# EasyEDA Pro project EdgeFouce_云台及电源管理.eprj, schematic Schematic1, sheet 5 of 5

## Sheets
5 电源切换: Page Name: P1
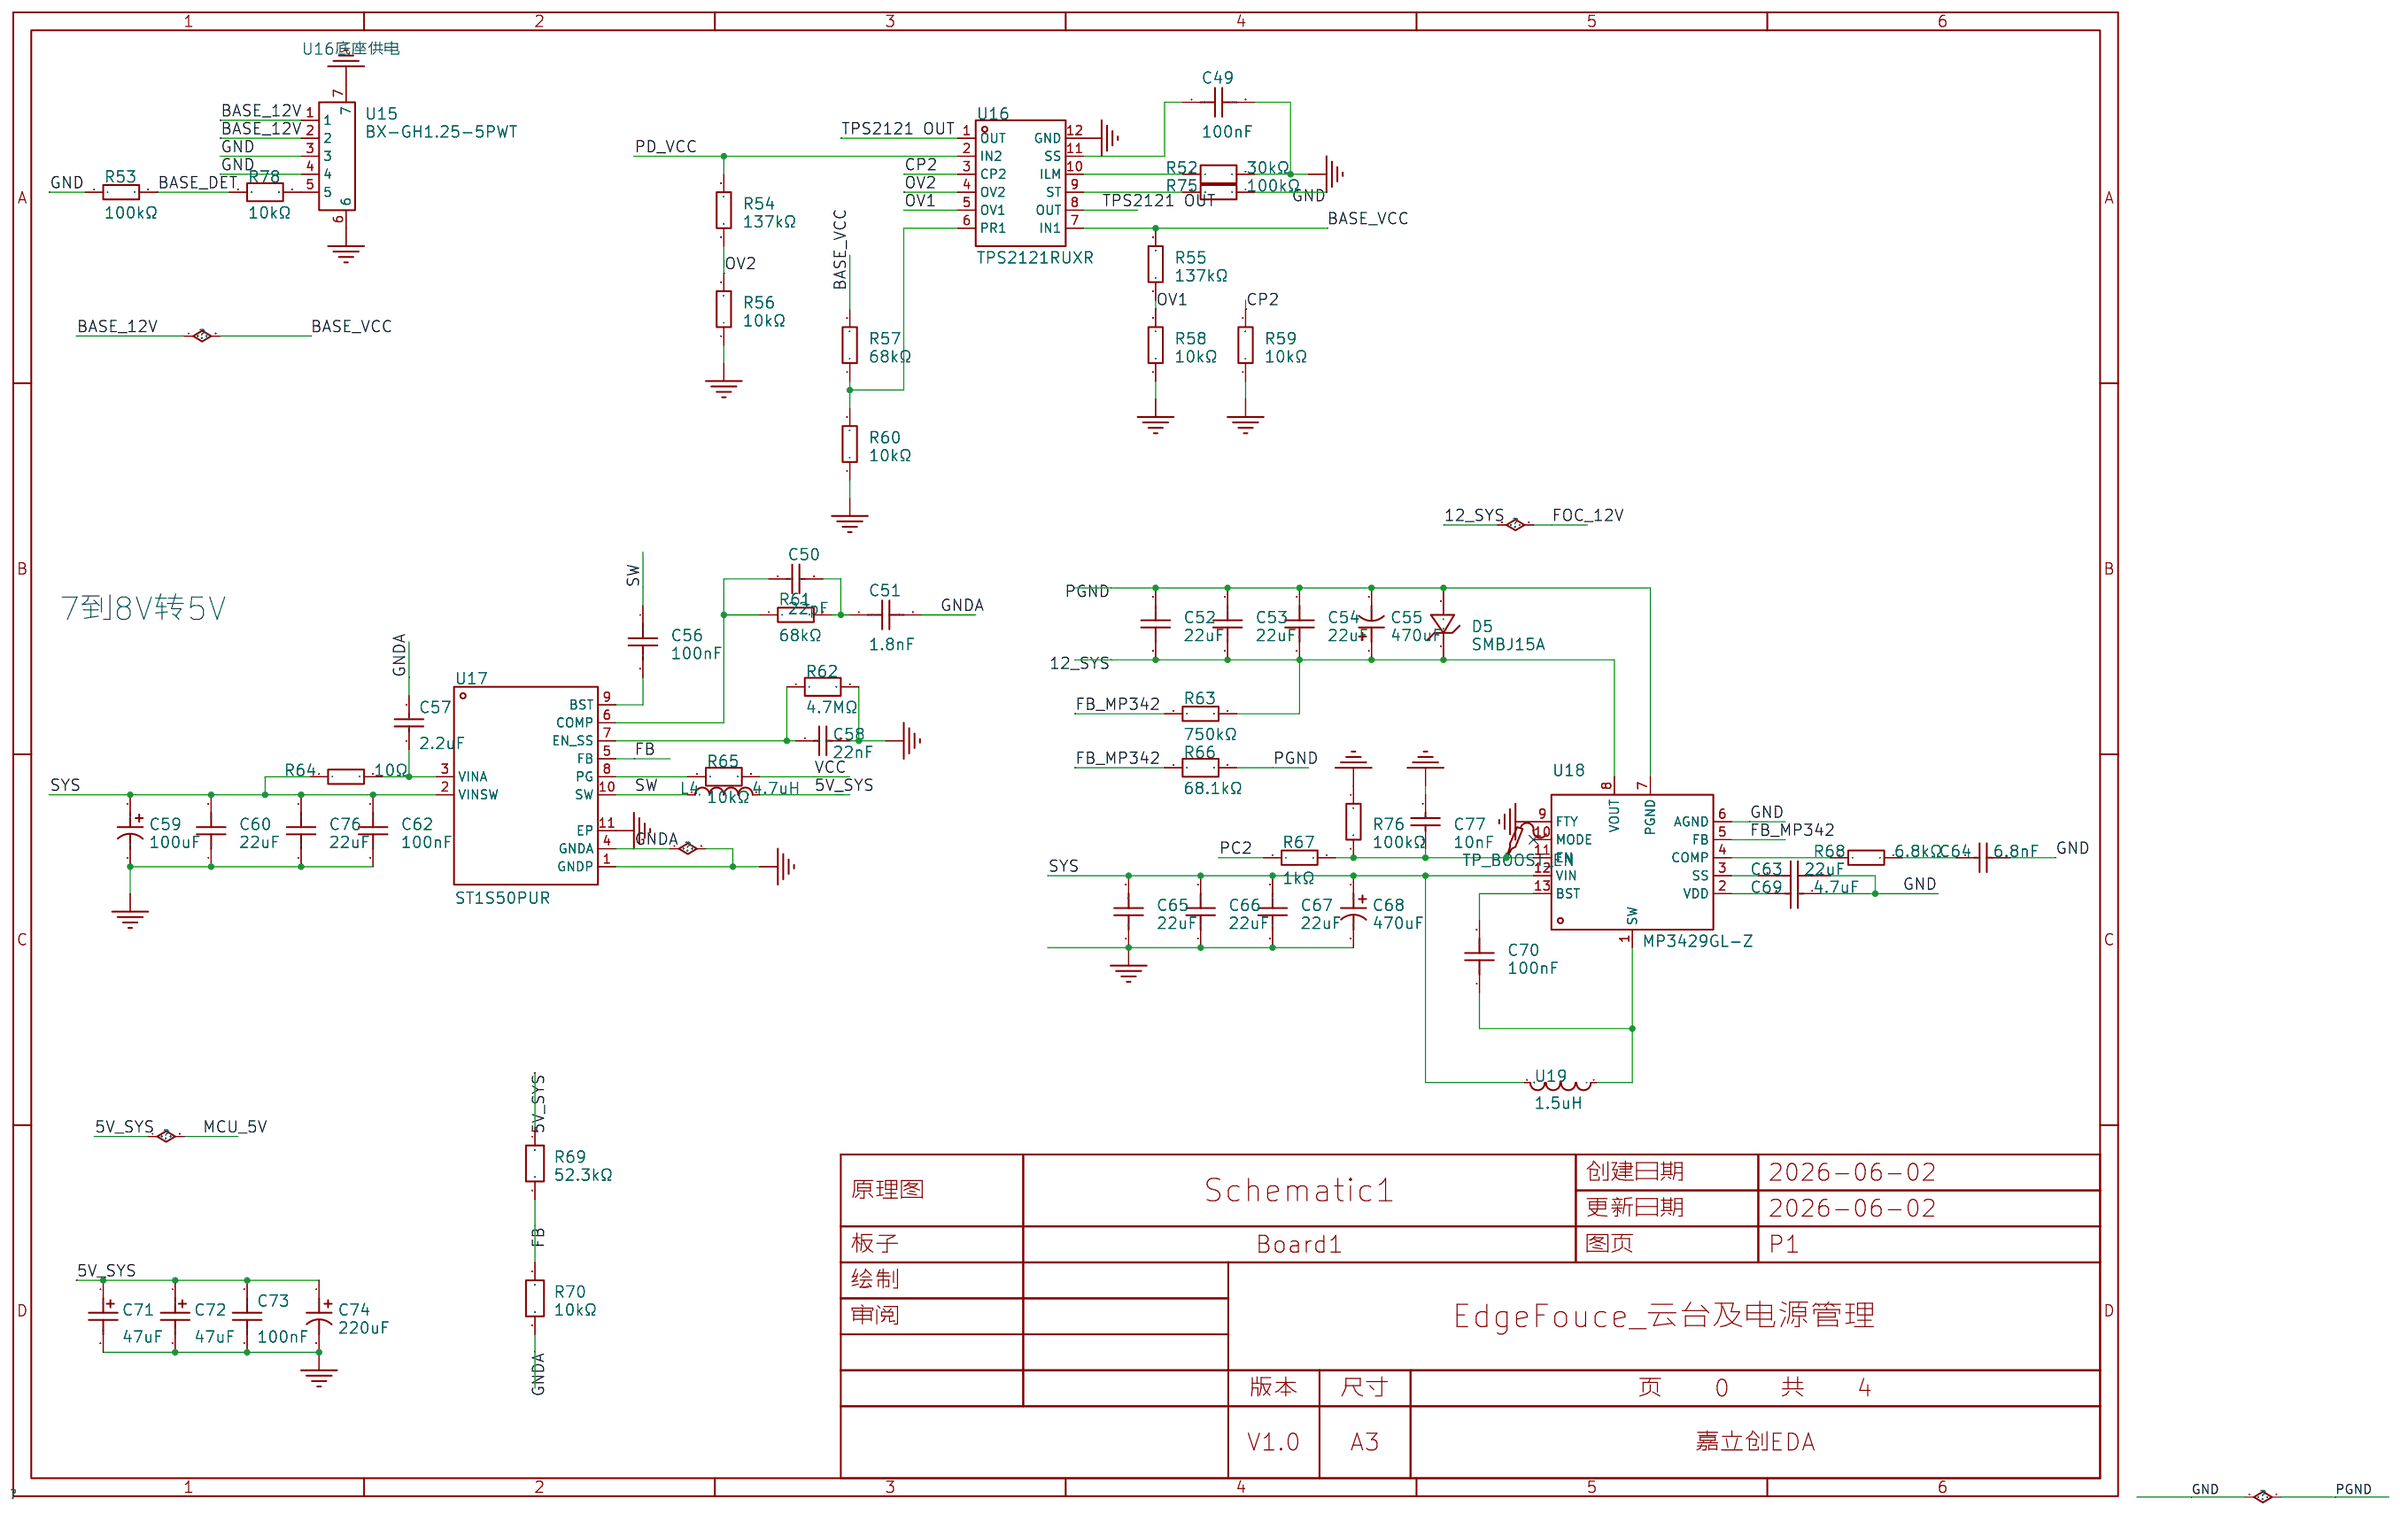
[diagram p4: 电源切换]

## Parts
C49  100nF  [C0805]
C50  22pF  [C0805]
C51  1.8nF  [C0603]
C52  22uF  [C0805]
C53  22uF  [C0805]
C54  22uF  [C0805]
C55  470uF  [CAP-SMD_BD10.0-L10.3-W10.3-LS11.0]
C56  100nF  [C0603]
C57  2.2uF  [C0603]
C58  22nF  [C0805]
C59  100uF  [CAP-SMD_BD6.3-L6.6-W6.6-RD]
C60  22uF  [C0805]
C62  100nF  [C0805]
C63  22uF  [C0805]
C64  6.8nF  [C0805]
C65  22uF  [C0805]
C66  22uF  [C0805]
C67  22uF  [C0805]
C68  470uF  [CAP-SMD_BD10.0-L10.3-W10.3-LS11.0]
C69  4.7uF  [C0805]
C70  100nF  [C0805]
C71  47uF  [CAP-SMD_L3.5-W2.8]
C72  47uF  [CAP-SMD_L3.5-W2.8]
C73  100nF  [C0603]
C74  220uF  [CAP-SMD_BD6.3-L6.6-W6.6-LS7.3-FD-H7.7]
C76  22uF  [C0805]
C77  10nF  [C0805]
D5  SMBJ15A  [SMB_L4.6-W3.6-LS5.3-RD]
L4  4.7uH  [IND-SMD_L7.5-W6.6]
R52  30kΩ  [R0805]
R53  100kΩ  [R0805]
R54  137kΩ  [R0805]
R55  137kΩ  [R0805]
R56  10kΩ  [R0805]
R57  68kΩ  [R0805]
R58  10kΩ  [R0805]
R59  10kΩ  [R0805]
R60  10kΩ  [R0805]
R61  68kΩ  [R0805]
R62  4.7MΩ  [R0805]
R63  750kΩ  [R0805]
R64  10Ω  [R0603]
R65  10kΩ  [R0805]
R66  68.1kΩ  [R0805]
R67  1kΩ  [R0805]
R68  6.8kΩ  [R0805]
R69  52.3kΩ  [R0603]
R70  10kΩ  [R0603]
R75  100kΩ  [R0805]
R76  100kΩ  [R0805]
R78  10kΩ  [R0805]
TP_BOOST_EN  -  [Test-Point-0.5mm]
U15  BX-GH1.25-5PWT  [CONN-SMD_5P-P1.25_BX-GH1.25-5PWT]
U16  TPS2121RUXR  [VQFN-HR-12_L2.5-W2.0-P0.50-BL]
U17  ST1S50PUR  [DFN-10_L3.0-W3.0-P0.50-BL-EP2.4-1]
U18  MP3429GL-Z  [QFN-13_L3.0-W4.0-P0.50-BL]
U19  1.5uH  [IND-SMD_L7.0-W6.6]

## Library data of the parts
C49 C62 = CC0805KRX7R9BB104: 容值:100nF;精度:±10%;额定电压:50V;温度系数:X7R;; LCSC Part Name: 100nF ±10% 50V; Supplier Part: C49678; Manufacturer: YAGEO(国巨); Supplier Footprint: 0805; JLCPCB Part Class: Basic Part; Datasheet: https://item.szlcsc.com/datasheet/CC0805KRX7R9BB104/50686.html; Supplier: LCSC; Tolerance: ±10%; Voltage Rating: 50V; Temperature Coefficient: X7R
C50 = CL21C220JBANNNC: 容值:22pF;精度:±5%;额定电压:50V;温度系数:C0G;; LCSC Part Name: 22pF ±5% 50V; Supplier Part: C1804; Manufacturer: SAMSUNG(三星); Supplier Footprint: 0805; JLCPCB Part Class: Basic Part; Datasheet: https://item.szlcsc.com/datasheet/CL21C220JBANNNC/2156.html; Supplier: LCSC; Tolerance: ±5%; Voltage Rating: 50V; Temperature Coefficient: C0G
C51 = CL10C182JB8NNNC: 容值:1.8nF;精度:±5%;额定电压:50V;温度系数:C0G;; LCSC Part Name: 1.8nF ±5% 50V; Supplier Part: C318642; Manufacturer: SAMSUNG(三星); Supplier Footprint: 0603; JLCPCB Part Class: Extended Part; Datasheet: https://item.szlcsc.com/datasheet/CL10C182JB8NNNC/299771.html; Supplier: LCSC; Tolerance: ±5%; Voltage Rating: 50V; Temperature Coefficient: C0G
C52-C54 C60 C63 C65-C67 C76 = CGA0805X5R226M250MT: 容值:22uF;精度:±20%;额定电压:25V;温度系数:X5R;; LCSC Part Name: 22uF ±20% 25V; Supplier Part: C6119899; Manufacturer: HRE(芯声); Supplier Footprint: 0805; JLCPCB Part Class: Extended Part; Datasheet: https://item.szlcsc.com/datasheet/CGA0805X5R226M250MT/7062605.html; Supplier: LCSC; Tolerance: ±20%; Voltage Rating: 25V; Temperature Coefficient: X5R
C55 C68 = JVJ35V470M10x10: 容值:470uF;精度:±20%;额定电压:35V;纹波电流:320mA@120Hz;; LCSC Part Name: 470uF ±20% 35V; Supplier Part: C46550413; Manufacturer: JIERR(捷而瑞); Supplier Footprint: SMD,D10xL10.5mm; JLCPCB Part Class: Extended Part; Datasheet: https://item.szlcsc.com/datasheet/JVJ35V470M10x10/48680107.html; Supplier: LCSC; Tolerance: ±20%; Voltage Rating: 35V; Ripple Current: 320mA@120Hz; Diameter: 10mm; Height - Seated (Max): 10.5mm; Lifetime: 2000hrs@105℃; Operating Temperature: -55℃~+105℃
C56 C73 = CGA0603X7R104K500JT: 容值:100nF;精度:±10%;额定电压:50V;温度系数:X7R;; LCSC Part Name: 100nF ±10% 50V; Supplier Part: C6119867; Manufacturer: HRE(芯声); Supplier Footprint: 0603; JLCPCB Part Class: Extended Part; Datasheet: https://item.szlcsc.com/datasheet/CGA0603X7R104K500JT/7062573.html; Supplier: LCSC; Tolerance: ±10%; Voltage Rating: 50V; Temperature Coefficient: X7R
C57 = CL10A225KO8NNNC: 容值:2.2uF;精度:±10%;额定电压:16V;温度系数:X5R;; LCSC Part Name: 2.2uF ±10% 16V; Supplier Part: C23630; Manufacturer: SAMSUNG(三星); Supplier Footprint: 0603; JLCPCB Part Class: Basic Part; Datasheet: https://item.szlcsc.com/datasheet/CL10A225KO8NNNC/24366.html; Supplier: LCSC; Tolerance: ±10%; Voltage Rating: 16V; Temperature Coefficient: X5R
C58 = CL21B223KBANNNC: 容值:22nF;精度:±10%;额定电压:50V;温度系数:X7R;; LCSC Part Name: 22nF ±10% 50V; Supplier Part: C1729; Manufacturer: SAMSUNG(三星); Supplier Footprint: 0805; JLCPCB Part Class: Basic Part; Datasheet: https://item.szlcsc.com/datasheet/CL21B223KBANNNC/2081.html; Supplier: LCSC; Tolerance: ±10%; Voltage Rating: 50V; Temperature Coefficient: X7R
C59 = MA35V100M6X8: 容值:100uF;精度:±20%;额定电压:35V;纹波电流:2.9A@100kHz;等效串联电阻(ESR):30mΩ@100kHz;类型:聚合物;; LCSC Part Name: 100uF ±20% 35V; Supplier Part: C46550467; Manufacturer: JIERR(捷而瑞); Supplier Footprint: SMD,D6.3xL7.7mm; JLCPCB Part Class: Extended Part; Datasheet: https://item.szlcsc.com/datasheet/MA35V100M6X8/48680161.html; Supplier: LCSC; Tolerance: ±20%; Voltage Rating: 35V; Ripple Current: 2.9A@100kHz; Equivalent Series Resistance(ESR): 30mΩ@100kHz; Type: 聚合物; Diameter: 6.3mm; Height - Seated (Max): 7mm; Lifetime: 2000hrs@105℃; Operating Temperature: -55℃~+105℃
C64 = GRM2195C1H682JA01D: 容值:6.8nF;精度:±5%;额定电压:50V;温度系数:C0G;; LCSC Part Name: 6.8nF ±5% 50V; Supplier Part: C77068; Manufacturer: muRata(村田); Supplier Footprint: 0805; JLCPCB Part Class: Extended Part; Datasheet: https://item.szlcsc.com/datasheet/GRM2195C1H682JA01D/78195.html; Supplier: LCSC; Tolerance: ±5%; Voltage Rating: 50V; Temperature Coefficient: C0G
C69 = CL21A475KAQNNNE: 容值:4.7uF;精度:±10%;额定电压:25V;温度系数:X5R;; LCSC Part Name: 4.7uF ±10% 25V; Supplier Part: C1779; Manufacturer: SAMSUNG(三星); Supplier Footprint: 0805; JLCPCB Part Class: Basic Part; Datasheet: https://item.szlcsc.com/datasheet/CL21A475KAQNNNE/2131.html; Supplier: LCSC; Tolerance: ±10%; Voltage Rating: 25V; Temperature Coefficient: X5R
C70 = FCC0805B104K500DT: 容值:100nF;精度:±10%;额定电压:50V;温度系数:X7R;; LCSC Part Name: 100nF ±10% 50V; Supplier Part: C5137467; Manufacturer: FOJAN(富捷); Supplier Footprint: 0805; JLCPCB Part Class: Extended Part; Datasheet: https://item.szlcsc.com/datasheet/FCC0805B104K500DT/5746969.html; Supplier: LCSC; Tolerance: ±10%; Voltage Rating: 50V; Temperature Coefficient: X7R
C71 C72 = TPSB476K010R0650: 容值:47uF;精度:±10%;额定电压:10V;等效串联电阻(ESR):650mΩ;; LCSC Part Name: 47uF ±10% 10V; Supplier Part: C4944896; Manufacturer: Kyocera AVX; Supplier Footprint: 1411; JLCPCB Part Class: Extended Part; Supplier: LCSC; Tolerance: ±10%; Voltage Rating: 10V; Equivalent Series Resistance(ESR): 650mΩ; Operating Temperature: -55℃~+125℃
C74 = JVJ25V220M6x8: 容值:220uF;精度:±20%;额定电压:25V;纹波电流:120mA@120Hz;; LCSC Part Name: 220uF ±20% 25V; Supplier Part: C46550404; Manufacturer: JIERR(捷而瑞); Supplier Footprint: SMD,D6.3xL7.7mm; JLCPCB Part Class: Extended Part; Datasheet: https://item.szlcsc.com/datasheet/JVJ25V220M6x8/48680098.html; Supplier: LCSC; Tolerance: ±20%; Voltage Rating: 25V; Ripple Current: 120mA@120Hz; Diameter: 6.3mm; Height - Seated (Max): 7.7mm; Lifetime: 2000hrs@105℃; Operating Temperature: -55℃~+105℃
C77 = CL21B103KBANNNC: 容值:10nF;精度:±10%;额定电压:50V;温度系数:X7R;; LCSC Part Name: 10nF ±10% 50V; Supplier Part: C1710; Manufacturer: SAMSUNG(三星); Supplier Footprint: 0805; JLCPCB Part Class: Basic Part; Datasheet: https://item.szlcsc.com/datasheet/CL21B103KBANNNC/2062.html; Supplier: LCSC; Tolerance: ±10%; Voltage Rating: 50V; Temperature Coefficient: X7R
D5 = SMBJ15A_C83846: 极性:单向;反向截止电压(Vrwm):15V;钳位电压:24.4V;峰值脉冲电流(Ipp):24.6A;峰值脉冲功率(Ppp):600W;击穿电压:16.7V;; LCSC Part Name: 单向TVS 15V截止 峰值浪涌电流：24.6A; Supplier Part: C83846; Manufacturer: Littelfuse(美国力特); Supplier Footprint: DO-214AA; JLCPCB Part Class: Extended Part; Datasheet: https://item.szlcsc.com/datasheet/SMBJ15A/85013.html; Supplier: LCSC; Polarity: 单向; Reverse Stand-Off Voltage (Vrwm): 15V; Clamping Voltage: 24.4V; Peak Pulse Current (Ipp): 24.6A; Peak Pulse Power Dissipation (Ppp): 600W; Voltage - Breakdown: 16.7V; Reverse Leakage Current (Ir): 1uA; Operating Temperature: -65℃~+150℃; level of protection: IEC 61000-4-4；IEC 61000-4-2; Type: TVS
L4 = PCR0630-4R7-M: 电感值:4.7uH;精度:±20%;额定电流:6A;饱和电流(Isat):8A;类型:一体成型电感;; LCSC Part Name: 4.7μH ±20% 8A; Supplier Part: C53896873; Manufacturer: JIERR(捷而瑞); Supplier Footprint: SMD,7.5x6.6mm; JLCPCB Part Class: Extended Part; Datasheet: https://item.szlcsc.com/datasheet/PCR0630-4R7-M/57092555.html; Supplier: LCSC; Tolerance: ±20%; Current Rating: 6A; Current - Saturation(Isat): 8A; DC Resistance(DCR): 45mΩ; Type: 一体成型电感
R52 = FRC0805F3002TS: 电阻类型:厚膜电阻;阻值:30kΩ;精度:±1%;功率:125mW;工作电压:150V;温度系数:±100ppm/℃;; LCSC Part Name: 30kΩ ±1% 125mW 厚膜电阻; Supplier Part: C2907255; Manufacturer: FOJAN(富捷); Supplier Footprint: 0805; JLCPCB Part Class: Extended Part; Supplier: LCSC; Type: 厚膜电阻; Tolerance: ±1%; Power(Watts): 125mW; Voltage-Supply(Max): 150V; Temperature Coefficient: ±100ppm/℃; Operating Temperature: -55℃~+155℃
R53 R75 R76 = 0805W8F1003T5E: 电阻类型:厚膜电阻;阻值:100kΩ;精度:±1%;功率:125mW;工作电压:150V;温度系数:±100ppm/℃;; LCSC Part Name: 100kΩ ±1% 125mW 厚膜电阻; Supplier Part: C149504; Manufacturer: UNI-ROYAL(厚声); Supplier Footprint: 0805; JLCPCB Part Class: Basic Part; Datasheet: https://item.szlcsc.com/datasheet/0805W8F1003T5E/160838.html; Supplier: LCSC; Type: 厚膜电阻; Tolerance: ±1%; Power(Watts): 125mW; Voltage-Supply(Max): 150V; Temperature Coefficient: ±100ppm/℃; Operating Temperature: -55℃~+155℃
R54 R55 = CR0805-FX-1373ELF: 电阻类型:厚膜电阻;阻值:137kΩ;精度:±1%;功率:125mW;工作电压:150V;温度系数:±100ppm/℃;; LCSC Part Name: 厚膜电阻 137kΩ ±1% 125mW; Supplier Part: C203741; Manufacturer: BOURNS; Supplier Footprint: 0805; JLCPCB Part Class: Extended Part; Datasheet: https://item.szlcsc.com/datasheet/CR0805-FX-1373ELF/205300.html; Supplier: LCSC; Type: 厚膜电阻; Tolerance: ±1%; Power(Watts): 125mW; Voltage-Supply(Max): 150V; Temperature Coefficient: ±100ppm/℃; Operating Temperature: -55℃~+155℃
R56 R58-R60 = 0805W8F1002T5E_C17414: 电阻类型:厚膜电阻;阻值:10kΩ;精度:±1%;功率:125mW;工作电压:150V;温度系数:±100ppm/℃;; LCSC Part Name: 10kΩ ±1% 125mW 厚膜电阻; Supplier Part: C17414; Manufacturer: UNI-ROYAL(厚声); Manufacturer Part: 0805W8F1002T5E; Supplier Footprint: 0805; JLCPCB Part Class: Basic Part; Datasheet: https://item.szlcsc.com/datasheet/0805W8F1002T5E/18102.html; Supplier: LCSC; Type: 厚膜电阻; Tolerance: ±1%; Power(Watts): 125mW; Voltage-Supply(Max): 150V; Temperature Coefficient: ±100ppm/℃; Operating Temperature: -55℃~+155℃
R57 R61 = 0805W8F6802T5E: 电阻类型:厚膜电阻;阻值:68kΩ;精度:±1%;功率:125mW;最大工作电压:150V;温度系数:±100ppm/℃;; LCSC Part Name: 68kΩ ±1% 125mW 厚膜电阻; Supplier Part: C17801; Manufacturer: UNI-ROYAL(厚声); Supplier Footprint: 0805; JLCPCB Part Class: Basic Part; Datasheet: https://atta.szlcsc.com/upload/public/pdf/source/20200306/C422600_1E6D84923E4A46A82E41ADD87F860B5C.pdf; Supplier: LCSC; Type: 厚膜电阻; Tolerance: ±1%; Power(Watts): 125mW; Overload Voltage (Max): 150V; Temperature Coefficient: ±100ppm/℃; Operating Temperature Range: -55℃~+155℃
R62 = FRC0805F4704TS: 电阻类型:厚膜电阻;阻值:4.7MΩ;精度:±1%;功率:125mW;工作电压:150V;温度系数:±100ppm/℃;; LCSC Part Name: 4.7MΩ ±1% 125mW 厚膜电阻; Supplier Part: C2933449; Manufacturer: FOJAN(富捷); Supplier Footprint: 0805; JLCPCB Part Class: Extended Part; Supplier: LCSC; Type: 厚膜电阻; Tolerance: ±1%; Power(Watts): 125mW; Voltage-Supply(Max): 150V; Temperature Coefficient: ±100ppm/℃; Operating Temperature: -55℃~+155℃
R63 = 0805W8F7503T5E: 电阻类型:厚膜电阻;阻值:750kΩ;精度:±1%;功率:125mW;工作电压:150V;温度系数:±100ppm/℃;; LCSC Part Name: 750kΩ ±1% 125mW 厚膜电阻; Supplier Part: C17817; Manufacturer: UNI-ROYAL(厚声); Supplier Footprint: 0805; JLCPCB Part Class: Extended Part; Datasheet: https://item.szlcsc.com/datasheet/0805W8F7503T5E/18505.html; Supplier: LCSC; Type: 厚膜电阻; Tolerance: ±1%; Power(Watts): 125mW; Voltage-Supply(Max): 150V; Temperature Coefficient: ±100ppm/℃; Operating Temperature: -55℃~+155℃
R64 = RC0603FR-0710RL: 电阻类型:厚膜电阻;阻值:10Ω;精度:±1%;功率:100mW;最大工作电压:75V;温度系数:±200ppm/℃;; LCSC Part Name: 厚膜电阻 10Ω ±1% 100mW; Supplier Part: C109318; Manufacturer: YAGEO(国巨); Supplier Footprint: 0603; JLCPCB Part Class: Extended Part; Datasheet: https://atta.szlcsc.com/upload/public/pdf/source/20180316/70C0E2BDAE7FCC62C531A5A58D202EE1.pdf; Supplier: LCSC; Type: 厚膜电阻; Tolerance: ±1%; Power(Watts): 100mW; Overload Voltage (Max): 75V; Temperature Coefficient: ±200ppm/℃; Operating Temperature Range: -55℃~+155℃
R65 R78 = FRC0805J103TS: 电阻类型:厚膜电阻;阻值:10kΩ;精度:±5%;功率:125mW;工作电压:150V;温度系数:±100ppm/℃;; LCSC Part Name: 10kΩ ±5% 125mW 厚膜电阻; Supplier Part: C2930231; Manufacturer: FOJAN(富捷); Supplier Footprint: 0805; JLCPCB Part Class: Extended Part; Supplier: LCSC; Type: 厚膜电阻; Tolerance: ±5%; Power(Watts): 125mW; Voltage-Supply(Max): 150V; Temperature Coefficient: ±100ppm/℃; Operating Temperature: -55℃~+155℃
R66 = FRC0805F6812TS: 电阻类型:厚膜电阻;阻值:68.1kΩ;精度:±1%;功率:125mW;工作电压:150V;温度系数:±100ppm/℃;; LCSC Part Name: 68.1kΩ ±1% 125mW 厚膜电阻; Supplier Part: C5713313; Manufacturer: FOJAN(富捷); Supplier Footprint: 0805; JLCPCB Part Class: Extended Part; Supplier: LCSC; Type: 厚膜电阻; Tolerance: ±1%; Power(Watts): 125mW; Voltage-Supply(Max): 150V; Temperature Coefficient: ±100ppm/℃; Operating Temperature: -55℃~+155℃
R67 = RT0805BRD071KL: 电阻类型:薄膜电阻;阻值:1kΩ;精度:±0.1%;功率:125mW;最大工作电压:150V;温度系数:±25ppm/℃;; LCSC Part Name: 薄膜电阻 1kΩ ±0.1% 125mW; Supplier Part: C110774; Manufacturer: YAGEO(国巨); Supplier Footprint: 0805; JLCPCB Part Class: Extended Part; Datasheet: https://atta.szlcsc.com/upload/public/pdf/source/20171026/C133380_15089840010201058857.pdf; Supplier: LCSC; Type: 薄膜电阻; Tolerance: ±0.1%; Power(Watts): 125mW; Overload Voltage (Max): 150V; Temperature Coefficient: ±25ppm/℃; Operating Temperature Range: -55℃~+155℃
R68 = 0805W8F6801T5E: 电阻类型:厚膜电阻;阻值:6.8kΩ;精度:±1%;功率:125mW;工作电压:150V;温度系数:±100ppm/℃;; LCSC Part Name: 6.8kΩ ±1% 125mW 厚膜电阻; Supplier Part: C17772; Manufacturer: UNI-ROYAL(厚声); Supplier Footprint: 0805; JLCPCB Part Class: Basic Part; Datasheet: https://item.szlcsc.com/datasheet/0805W8F6801T5E/18460.html; Supplier: LCSC; Type: 厚膜电阻; Tolerance: ±1%; Power(Watts): 125mW; Voltage-Supply(Max): 150V; Temperature Coefficient: ±100ppm/℃; Operating Temperature: -55℃~+155℃
R69 = TNPW060352K3BEEA: 电阻类型:薄膜电阻;阻值:52.3kΩ;精度:±0.1%;功率:100mW;温度系数:±25ppm/℃;; LCSC Part Name: 薄膜电阻 52.3kΩ ±0.1% 100mW; Supplier Part: C4241066; Manufacturer: VISHAY(威世); Supplier Footprint: 0603; JLCPCB Part Class: Extended Part; Datasheet: https://atta.szlcsc.com/upload/public/pdf/source/20231211/C48E8DEF84219C0109456A885F4ED62F.pdf; Supplier: LCSC; Type: 薄膜电阻; Tolerance: ±0.1%; Power(Watts): 100mW; Temperature Coefficient: ±25ppm/℃; Operating Temperature Range: -55℃~+155℃
R70 = FRC0603J103 TS: 电阻类型:厚膜电阻;阻值:10kΩ;精度:±5%;功率:100mW;工作电压:75V;温度系数:±100ppm/℃;; LCSC Part Name: 10kΩ ±5% 100mW 厚膜电阻; Supplier Part: C2930027; Manufacturer: FOJAN(富捷); Supplier Footprint: 0603; JLCPCB Part Class: Extended Part; Datasheet: https://item.szlcsc.com/datasheet/FRC0603J103%2520TS/3266960.html; Supplier: LCSC; Type: 厚膜电阻; Tolerance: ±5%; Power(Watts): 100mW; Voltage-Supply(Max): 75V; Temperature Coefficient: ±100ppm/℃; Operating Temperature: -55℃~+155℃
TP_BOOST_EN = Test-Point: Test Point 测试点
U15 = BX-GH1.25-5PWT: 插针结构:1x5P;间距:1.25mm;安装方式:卧贴;参考系列:GH;总PIN数:5P;排数:1;每排PIN数:5;行距:-;额定电流:1A;触头材质:磷铜;触头镀层:锡;工作温度:-25℃~+85℃;; LCSC Part Name: 1x5P 间距:1.25mm 卧贴 系列:GH; Supplier Part: C18077721; Manufacturer: Bossie(博锡); Supplier Footprint: SMD,P=1.25mm,卧贴; JLCPCB Part Class: Extended Part; Datasheet: https://item.szlcsc.com/datasheet/BX-GH1.25-5PWT/19218122.html; Supplier: LCSC; Pins Structure: 1x5P; Pitch: 1.25mm; Mounting Type: 卧贴; Reference Series: GH; Number of Pins: 5P; Number of Rows: 1; Number of PINs Per Row: 5; Current Rating: 1A; Contact Material: 磷铜; Contact Plating: 锡; Operating Temperature: -25℃~+85℃; Voltage Rating: 125V; Plastic Material: LCP; Supplementary Features: 辅助焊脚; Color: 米色; Z-Height of the Board: 4.35mm; X-Length of Bottom Edge on Board (Spacing Line): 9.5mm; Y-Width of Bottom Edge on Board: 5mm
U16 = TPS2121RUXR: TPS2121 支持无缝切换的 2.7V 至 22V、56mΩ、4.5A 电源多路复用器; Supplier Part: C485916; Manufacturer: TI(德州仪器); Supplier Footprint: VQFN-HR-12(2x2.5); JLCPCB Part Class: Extended Part; Datasheet: https://www.ti.com/cn/lit/gpn/tps2121; Supplier: LCSC
U17 = ST1S50PUR: 功能类型:降压型;输出类型:可调;工作电压:4V~18V;输出电压:800mV~15.84V;输出电流:4A;; LCSC Part Name: 4A同步降压转换器; Supplier Part: C2970157; Manufacturer: ST(意法半导体); Supplier Footprint: VFDFPN-10(3x3); Datasheet: https://atta.szlcsc.com/upload/public/pdf/source/20221107/0EE25678EA74484F7737DA0BD1FC71FE.pdf; Supplier: LCSC; Function: 降压型; Output Type: 可调; Input Voltage: 4V~18V; Output Voltage: 800mV~15.84V; Output Current: 4A; Switching Frequency: 500kHz; Operating Temperature: -40℃~+150℃@(TJ); Synchronous Rectification: 是; Number of Outputs: 1; Topology: 降压式; Switch tube (built-in/external): 内置
U18 = MP3429GL-Z: 功能类型:升压型;输出类型:可调;工作电压:800mV~13V;输出电压:-;输出电流:-;; LCSC Part Name: 高效率、全集成同步升压转换器; Supplier Part: C188410; Manufacturer: MPS(芯源); Supplier Footprint: QFN-13(3x4); JLCPCB Part Class: Extended Part; Datasheet: https://item.szlcsc.com/datasheet/MP3429GL-Z/199817.html; Supplier: LCSC; Function: 升压型; Output Type: 可调; Voltage - Supply: 800mV~13V; Frequency - Switching: 600kHz; Operating Temperature: -40℃~+125℃@(TJ); Synchronous Rectifier: 是; Number of Outputs: 1; Topology: 升压式; Quiescent Current: 450uA; Switch tube (built-in/external): 内置
U19 = 0624CDMCCDS-1R5MC: 电感值:1.5uH;精度:±20%;额定电流:8.7A;饱和电流(Isat):15A;类型:一体成型电感;; LCSC Part Name: 1.5uH ±20% 15A; Supplier Part: C2453461; Manufacturer: Sumida(胜美达); Supplier Footprint: SMD,7x6.6mm; JLCPCB Part Class: Extended Part; Datasheet: https://item.szlcsc.com/datasheet/0624CDMCCDS-1R5MC/2545316.html; Supplier: LCSC; Tolerance: ±20%; Current Rating: 8.7A; Current - Saturation(Isat): 15A; DC Resistance(DCR): 16mΩ; Type: 一体成型电感

## Nets
GND: C49.2 C51.2 C52.1 C53.1 C54.1 C55.2 C57.2 C58.2 C59.2 C60.1 C62.1 C63.2 C64.2 C65.1 C66.1 C67.1 C68.2 C69.2 C71.2 C72.2 C73.1 C74.2 C76.1 C77.2 D5.2 R52.2 R53.1 R56.1 R58.1 R59.1 R60.1 R62.2 R66.2 R70.2 R75.1 R76.1 U15.3 U15.4 U15.6 U15.7 U16.12(GND) U17.1(GNDP) U17.4(GNDA) U17.11(EP) U18.6(AGND) U18.7(PGND) U18.9(FTY) ; also on sheet 1 2 3 4
VCC: R65.2 ; also on sheet 1 3
12_SYS: C52.2 C53.2 C54.2 C55.1 D5.1 R63.1 U18.8(VOUT) ; also on sheet 2
BASE_12V: R55.2 R57.2 U15.1 U15.2 U16.7(IN1)
BASE_DET: R53.2 R78.1 ; also on sheet 4
BAT_VCC: U16.1(OUT) U16.8(OUT) ; also on sheet 4
CP2: R59.2 U16.3(CP2)
FB: R69.2 R70.1 U17.5(FB)
FB_MP342: R63.2 R66.1 U18.5(FB)
MCU_5V: C71.1 C72.1 C73.2 C74.1 L4.2 R69.1 ; also on sheet 1 2
OV1: R55.1 R58.2 U16.5(OV1)
OV2: R54.1 R56.2 U16.4(OV2)
PC2: R67.1 ; also on sheet 1
SW: C56.1 L4.1 U17.10(SW)
SYS: C59.1 C60.2 C62.2 C65.2 C66.2 C67.2 C68.1 C76.2 R64.1 U17.2(VINSW) U18.12(VIN) U19.2 ; also on sheet 4
VSINK: R54.2 U16.2(IN2) ; also on sheet 3
$5N22: R57.1 R60.2 U16.6(PR1)
$5N30: R52.1 U16.10(ILM)
$5N32: C49.1 U16.11(SS)
$5N36: R65.1 U17.8(PG)
$5N45: C50.2 C51.1 R61.2
$5N46: C50.1 R61.1 U17.6(COMP)
$5N50: C58.1 R62.1 U17.7(EN_SS)
$5N60: C57.1 R64.2 U17.3(VINA)
$5N61: C56.2 U17.9(BST)
$5N70: C77.1 R67.2 R76.2 TP_BOOST_EN.1 U18.11(EN)
$5N72: C64.1 R68.2
$5N73: R68.1 U18.4(COMP)
$5N74: C63.1 U18.3(SS)
$5N75: C70.2 U18.13(BST)
$5N78: C69.1 U18.2(VDD)
$5N84: C70.1 U18.1(SW) U19.1
$5N100: R75.2 U16.9(ST)
$5N105: R78.2 U15.5

Not connected (* = marked no-connect by the designer): U18 10(MODE)*

## Notes on the sheets
sheet 5
- U16底座供电
- 7到8V转5V
